# Altium project MM32F3277G9P.PrjPCB
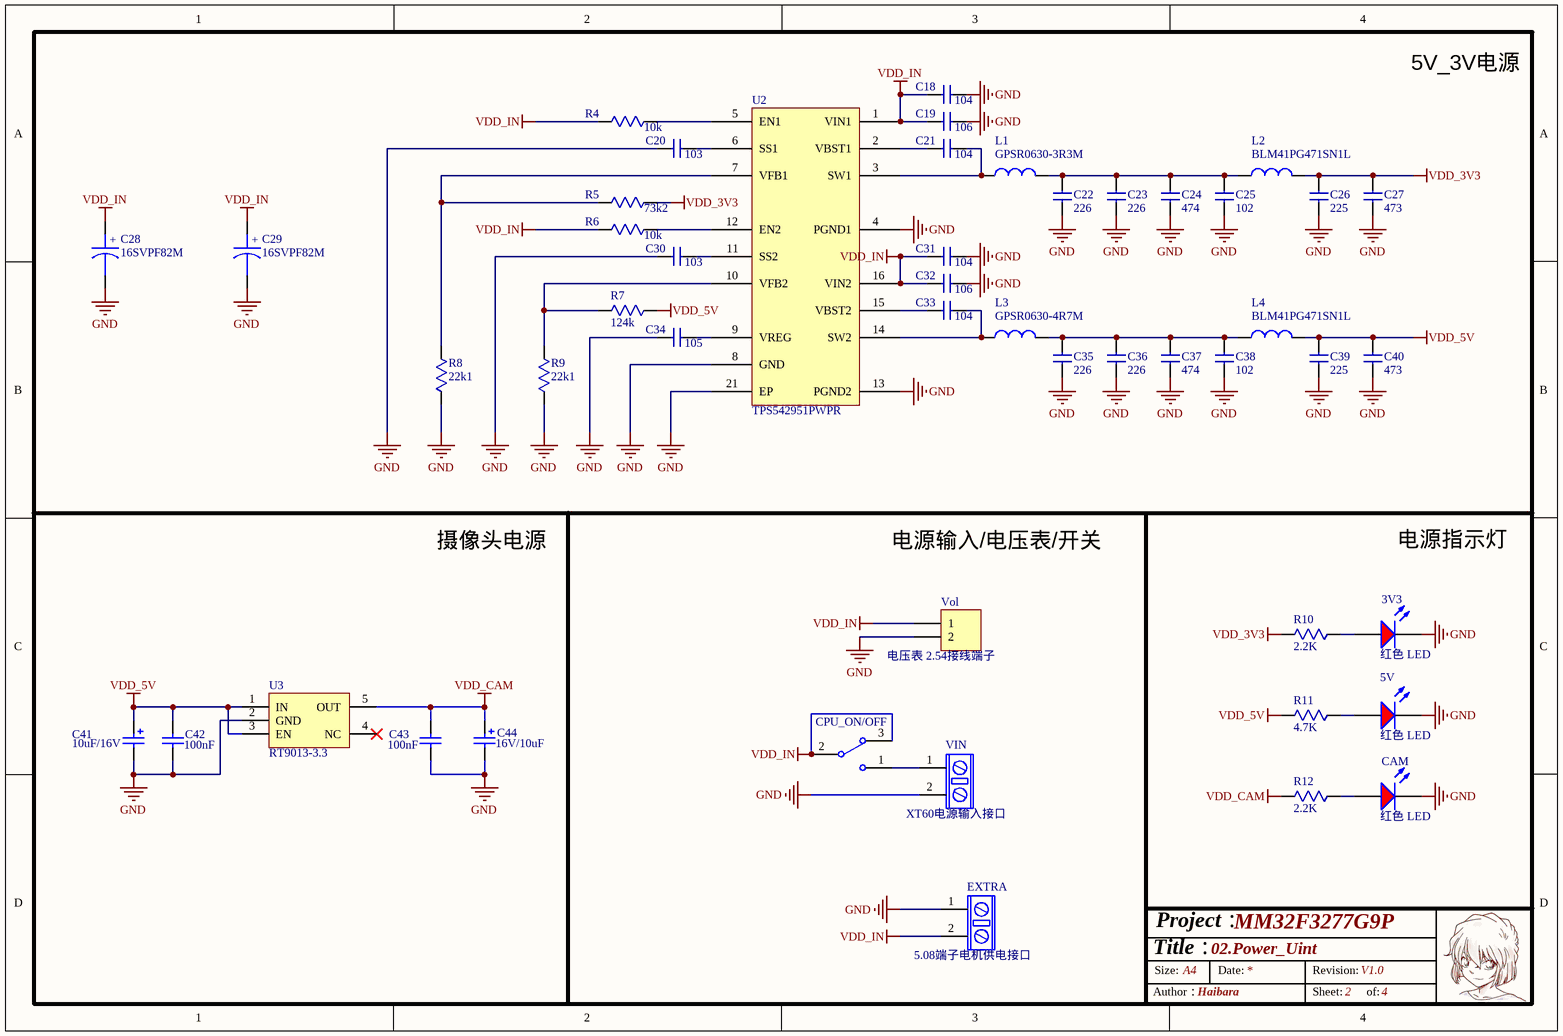
[diagram p0: 02.Power_Uint.SchDoc]
3 sheets, 90 parts. Net scope: global (net labels, ports and power ports of the same name join across sheets).
Board files: MM32F3277G9P V2.PcbDoc, MM32F3277G9P.PcbDoc
Sheets:
  02.Power_Uint.SchDoc
  03.Communicate.SchDoc
  04.Input_Output.SchDoc

## Sheet 02.Power_Uint.SchDoc: 02.Power_Uint
size A4; Organization: Altium Limited; Address1: L3, 12a Rodborough Rd; Address2: Frenchs Forest; Address3: NSW; Address4: Australia 2086; SheetNumber: 2; SheetTotal: 4

### Parts
3V3  红色 LED  [0603 LED R]
5V  红色 LED  [0603 LED R]
C18  104  [C0603]
C19  106  [C0805]
C20  103  [C0603]
C21  104  [C0805]
C22  226  [C0805]
C23  226  [C0805]
C24  474  [C0603]
C25  102  [C0603]
C26  225  [C0603]
C27  473  [C0603]
C28  16SVPF82M  [CAP 2.5*6.3*11.2]
C29  16SVPF82M  [CAP 2.5*6.3*11.2]
C30  103  [C0603]
C31  104  [C0603]
C32  106  [C0805]
C33  104  [C0805]
C34  105  [C0603]
C35  226  [C0805]
C36  226  [C0805]
C37  474  [C0603]
C38  102  [C0603]
C39  225  [C0603]
C40  473  [C0603]
C41  10UF  [C0805]  (value not drawn)
C42  100nF  [0603 电容 C3]
C43  100nF  [0603 电容 C3]
C44  value 16V/10uF  [C0805]  (hidden comment: 10UF)
CAM  红色 LED  [0603 LED R]
CPU_ON/OFF  SW-SPDT  [MTS-102S 两档纽子开关]  (value not drawn)
EXTRA  5.08端子电机供电接口  [5.08 螺钉式 2p]
L1  GPSR0630-3R3M  [L 0630]
L2  BLM41PG471SN1L  [R1206]
L3  GPSR0630-4R7M  [L 0630]
L4  BLM41PG471SN1L  [R1206]
R4  10k  [R0603]
R5  73k2  [R0603]
R6  10k  [R0603]
R7  124k  [R0603]
R8  22k1  [R0603]
R9  22k1  [R0603]
R10  2.2K  [R0603]
R11  4.7K  [R0603]
R12  2.2K  [R0603]
U2  TPS542951PWPR  [SSOP16_EP]
U3  RT9013-3.3  [SOT23-5N]
VIN  XT60电源输入接口  [XT60 母头 电源接口]
Vol  电压表 2.54接线端子  [XH2.54-LI-2P]

### Nets
GND: 3V3.2 5V.2 C18.2 C19.2 C20.1 C22.1 C23.1 C24.1 C25.1 C26.1 C27.1 C28.2 C29.2 C30.1 C31.2 C32.2 C34.1 C35.1 C36.1 C37.1 C38.1 C39.1 C40.1 C41.2 C42.1 C43.1 C44.2 CAM.2 EXTRA.1 R8.1 R9.1 U2.4(PGND1) U2.8(GND) U2.13(PGND2) U2.21(EP) U3.2(GND) VIN.2 Vol.2
VDD_3V3: C26.2 C27.2 L2.2 R5.1 R10.1
VDD_5V: C39.2 C40.2 C41.1 C42.2 L4.2 R7.1 R11.1 U3.1(IN) U3.3(EN)
VDD_CAM: C43.2 C44.1 R12.1 U3.5(OUT)
VDD_IN: C18.1 C19.1 C28.1 C29.1 C31.1 C32.1 CPU_ON/OFF.2 CPU_ON/OFF.3 EXTRA.2 R4.2 R6.2 U2.1(VIN1) U2.16(VIN2) Vol.1
Net3V3_1: 3V3.1 R10.2
Net5V_1: 5V.1 R11.2
NetC20_2: C20.2 U2.6(SS1)
NetC21_1: C21.1 U2.2(VBST1)
NetC21_2: C21.2 L1.1 U2.3(SW1)
NetC22_2: C22.2 C23.2 C24.2 C25.2 L1.2 L2.1
NetC30_2: C30.2 U2.11(SS2)
NetC33_1: C33.1 U2.15(VBST2)
NetC33_2: C33.2 L3.1 U2.14(SW2)
NetC34_2: C34.2 U2.9(VREG)
NetC35_2: C35.2 C36.2 C37.2 C38.2 L3.2 L4.1
NetCAM_1: CAM.1 R12.2
NetCPU_ON/OFF_1: CPU_ON/OFF.1 VIN.1
NetR4_1: R4.1 U2.5(EN1)
NetR5_2: R5.2 R8.2 U2.7(VFB1)
NetR6_1: R6.1 U2.12(EN2)
NetR7_2: R7.2 R9.2 U2.10(VFB2)

Not connected (* = marked no-connect by the designer): U3 4(NC)*

### Notes on the sheet
- Labels drawn without touching a wire or pin: 5V_3V电源, 摄像头电源, 电源指示灯, 电源输入/电压表/开关
- Title：
- Size:
- Project：
- A4
- Date:
- MM32F3277G9P
- Revision:
- V1.0
- Author：
- Haibara
- Sheet:
- of:
- (in symbol CAP POL) +
- (in symbol Cap Pol2) 16V

### Library data of the parts
3V3 5V CAM = 红灯: 发光二极管; ComponentLink1Description: 供应商链接; ComponentLink1URL: http://www.szlcsc.com/product/details_2668.html; Package: 0805; Supplier: LC; SuppliersPartNumber: C2295
C18-C27 C30-C40 = 电容
C28 C29 = CAP POL: Capacitor
C41 C44 = Cap Pol2: Polarized Capacitor (Axial); Published: 8-Jun-2000; LatestRevisionDate: 17-Jul-2002; LatestRevisionNote: Re-released for DXP Platform.; PackageReference: POLAR0.8; Publisher: Altium Limited; PackageDescription: Polarized Capacitor; 2 Leads
C42 C43 = Cap: Capacitor; Published: 8-Jun-2000; LatestRevisionDate: 17-Jul-2002; LatestRevisionNote: Re-released for DXP Platform.; PackageReference: RAD-0.3; Publisher: Altium Limited; PackageDescription: Radial Cap, Thru-Hole; 2 Leads; 0.3 in Pin Spacing
CPU_ON/OFF = SW-SPDT: SPDT Subminiature Toggle Switch, Right Angle Mounting, Vertical Actuation; Published: 24-Mar-1999; LatestRevisionDate: 17-Dec-2003; LatestRevisionNote: Schematic revised, PCB Footprint replaced.; DatasheetVersion: 05-Dec-2000; PackageReference: TL36WW15050; Publisher: Altium Limited; PackageDescription: Switch; 4 Leads; ComponentLink1Description: Manufacturer Link; ComponentLink1URL: http://www.apem.com
EXTRA VIN = 电机供电接口
L1 L3 = 电感
L2 L4 = 磁珠: BLM18PG471SN1D
R4-R12 = 电阻
U3 = RT9013-3.3: 3.3V电源芯片
Vol = Header 2: Header, 2-Pin; LatestRevisionDate: 17-Jul-2002; LatestRevisionNote: Re-released for DXP Platform.; Publisher: Altium Limited

## Sheet 03.Communicate.SchDoc: 03.Communicate
size A4; Organization: Altium Limited; Address1: L3, 12a Rodborough Rd; Address2: Frenchs Forest; Address3: NSW; Address4: Australia 2086; SheetNumber: 3; SheetTotal: 4
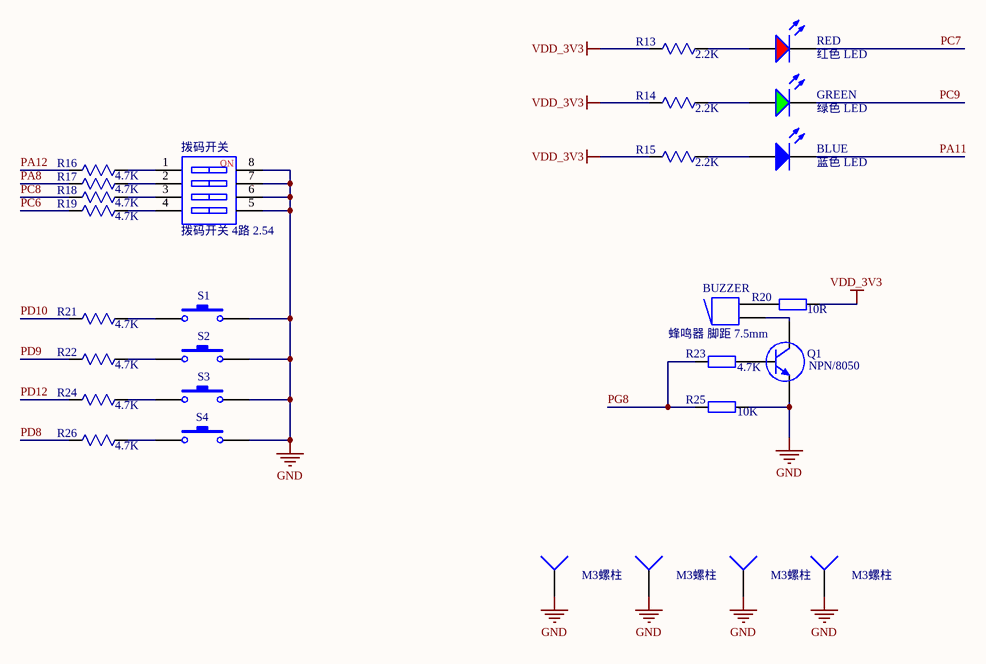
[diagram p1: 03.Communicate.SchDoc]

### Parts
BLUE  蓝色 LED  [0603 LED B]
BUZZER  蜂鸣器 脚距 7.5mm  [蜂鸣器5.5mm脚距]
GREEN  绿色 LED  [0603 LED G]
J1  M3螺柱  [MTGP720H320V6P - duplicate]
J2  M3螺柱  [MTGP720H320V6P - duplicate]
J3  M3螺柱  [MTGP720H320V6P - duplicate]
J4  M3螺柱  [MTGP720H320V6P - duplicate]
Q1  NPN/8050  [SOT232-3 三极管]
R13  2.2K  [R0603]
R14  2.2K  [R0603]
R15  2.2K  [R0603]
R16  4.7K  [R0603]
R17  4.7K  [R0603]
R18  4.7K  [R0603]
R19  4.7K  [R0603]
R20  value 10R  [0603 电阻 R3]  (hidden comment: 4.7K)
R21  4.7K  [R0603]
R22  4.7K  [R0603]
R23  4.7K  [0603 电阻 R3]
R24  4.7K  [R0603]
R25  value 10K  [0603 电阻 R3]  (hidden comment: 4.7K)
R26  4.7K  [R0603]
RED  红色 LED  [0603 LED R]
S1  SW-PB  [TSW SMD-3*6*2.5]  (value not drawn)
S2  SW-PB  [TSW SMD-3*6*2.5]  (value not drawn)
S3  SW-PB  [TSW SMD-3*6*2.5]  (value not drawn)
S4  SW-PB  [TSW SMD-3*6*2.5]  (value not drawn)
拨码开关  拨码开关 4路 2.54  [CSW DIP-2P_G]

### Nets
GND: J1.1 J2.1 J3.1 J4.1 Q1.2(E) R25.2 S1.2 S2.2 S3.2 S4.2 拨码开关.5 拨码开关.6 拨码开关.7 拨码开关.8
VDD_3V3: R13.1 R14.1 R15.1 R20.2
PA8: R17.1
PA11: BLUE.2
PA12: R16.1
PC6: R19.1
PC7: RED.2
PC8: R18.1
PC9: GREEN.2
PD8: R26.1
PD9: R22.1
PD10: R21.1
PD12: R24.1
PG8: R23.1 R25.1
NetBLUE_1: BLUE.1 R15.2
NetBUZZER_1: BUZZER.1 R20.1
NetBUZZER_2: BUZZER.2 Q1.3(C)
NetGREEN_1: GREEN.1 R14.2
NetQ1_1: Q1.1(B) R23.2
NetR13_2: R13.2 RED.1
NetR16_2: R16.2 拨码开关.1
NetR17_2: R17.2 拨码开关.2
NetR18_2: R18.2 拨码开关.3
NetR19_2: R19.2 拨码开关.4
NetR21_2: R21.2 S1.1
NetR22_2: R22.2 S2.1
NetR24_2: R24.2 S3.1
NetR26_2: R26.2 S4.1

### Notes on the sheet
- Title：
- Size:
- Project：
- A4
- Date:
- MM32F3277G9P
- Revision:
- V1.0
- Author：
- Haibara
- Sheet:
- of:
- (in symbol CSW-4P) NO

### Library data of the parts
BLUE = 蓝灯: 发光二极管; ComponentLink1Description: 供应商链接; ComponentLink1URL: http://www.szlcsc.com/product/details_2666.html; Package: 0805; Supplier: LC; SuppliersPartNumber: C2293
BUZZER = Buzzer: Magnetic Transducer Buzzer; Published: 24-Mar-1999; LatestRevisionDate: 17-Dec-2003; LatestRevisionNote: Schematic revised, PCB Footprint replaced.; DatasheetVersion: 17-Dec-2003; PackageReference: ABSM-1574; Publisher: Altium Limited; PackageDescription: Magnetic Transducer Buzzer; ComponentLink1Description: Manufacturer Link; ComponentLink1URL: http://www.megastar.com/linecard/buzzmode/index.php
GREEN = 绿灯: 发光二极管; ComponentLink1Description: 供应商链接; ComponentLink1URL: http://www.szlcsc.com/product/details_2670.html; Package: 0805; Supplier: LC; SuppliersPartNumber: C2297
J1-J4 = Socket: LatestRevisionDate: 17-Jul-2002; LatestRevisionNote: Re-released for DXP Platform.; Publisher: Altium Limited
R13-R19 R21 R22 R24 R26 = 电阻
R20 R25 = Res2: Resistor; Published: 8-Jun-2000; LatestRevisionDate: 17-Jul-2002; LatestRevisionNote: Re-released for DXP Platform.; PackageReference: AXIAL-0.4; Publisher: Altium Limited; PackageDescription: Axial Device, Thru-Hole; 2 Leads; 0.4 in Pin Spacing
R23 = Res2: Resistor; Value: 4.7R; Published: 8-Jun-2000; LatestRevisionDate: 17-Jul-2002; LatestRevisionNote: Re-released for DXP Platform.; PackageReference: AXIAL-0.4; Publisher: Altium Limited; PackageDescription: Axial Device, Thru-Hole; 2 Leads; 0.4 in Pin Spacing
RED = 红灯: 发光二极管; ComponentLink1Description: 供应商链接; ComponentLink1URL: http://www.szlcsc.com/product/details_2668.html; Package: 0805; Supplier: LC; SuppliersPartNumber: C2295
S1-S4 = SW-PB: Switch; Published: 24-Mar-1999; LatestRevisionDate: 17-Jul-2002; LatestRevisionNote: Re-released for DXP Platform.; PackageReference: SPST-2; Publisher: Altium Limited; PackageDescription: Switch; 2 Leads
拨码开关 = CSW-4P: 4路编码开关; 版权归属: 源创客; BOM名称: 4路编码开关; 学习资源: www.ooocke.com

## Sheet 04.Input_Output.SchDoc: 04.Input_Output
size A4; Organization: Altium Limited; Address1: L3, 12a Rodborough Rd; Address2: Frenchs Forest; Address3: NSW; Address4: Australia 2086; SheetNumber: 4; SheetTotal: 4
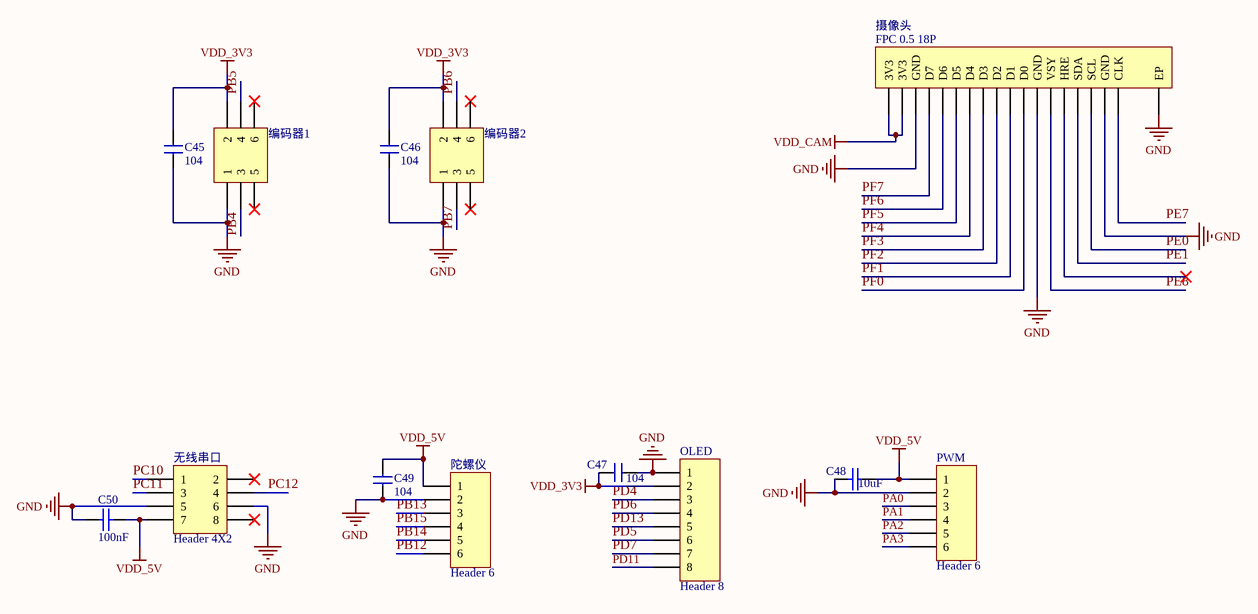
[diagram p2: 04.Input_Output.SchDoc]

### Parts
C45  104  [C0603]
C46  104  [C0603]
C47  104  [C0603]
C48  10UF  [0603 电容 C3]
C49  104  [C0603]
C50  100nF  [0603 电容 C3]
OLED  Header 8  [HDR2.54-LI-8P]
PWM  Header 6  [MX 1.25-WS-6P]
摄像头  FPC 0.5 18P  [FPC0.5 2H-WS-18P]
无线串口  Header 4X2  [HDR2.54-LI-2x4P]
编码器1  Header 3X2  [DC-2.54-L-Z-6P]  (value not drawn)
编码器2  Header 3X2  [DC-2.54-L-Z-6P]  (value not drawn)
陀螺仪  Header 6  [MX 1.25-WS-6P]

### Nets
GND: C45.1 C46.1 C47.2 C48.1 C49.1 C50.2 OLED.1 PWM.2 摄像头.0(EP) 摄像头.3(GND) 摄像头.12(GND) 摄像头.17(GND) 无线串口.5 无线串口.6 编码器1.1 编码器2.1 陀螺仪.2
VDD_3V3: C45.2 C46.2 C47.1 OLED.2 编码器1.2 编码器2.2
VDD_5V: C48.2 C49.2 C50.1 PWM.1 无线串口.7 陀螺仪.1
VDD_CAM: 摄像头.1(3V3) 摄像头.2(3V3)
PA0: PWM.3
PA1: PWM.4
PA2: PWM.5
PA3: PWM.6
PB4: 编码器1.3
PB5: 编码器1.4
PB6: 编码器2.4
PB7: 编码器2.3
PB12: 陀螺仪.6
PB13: 陀螺仪.3
PB14: 陀螺仪.5
PB15: 陀螺仪.4
PC10: 无线串口.1
PC11: 无线串口.3
PC12: 无线串口.4
PD4: OLED.3
PD5: OLED.6
PD6: OLED.4
PD7: OLED.7
PD11: OLED.8
PD13: OLED.5
PE0: 摄像头.16(SCL)
PE1: 摄像头.15(SDA)
PE7: 摄像头.18(CLK)
PE8: 摄像头.13(VSY)
PF0: 摄像头.11(D0)
PF1: 摄像头.10(D1)
PF2: 摄像头.9(D2)
PF3: 摄像头.8(D3)
PF4: 摄像头.7(D4)
PF5: 摄像头.6(D5)
PF6: 摄像头.5(D6)
PF7: 摄像头.4(D7)

Not connected (* = marked no-connect by the designer): 摄像头 14(HRE)*; 无线串口 2* 8*; 编码器1 5* 6*; 编码器2 5* 6*

### Notes on the sheet
- Title：
- Size:
- Project：
- A4
- Date:
- MM32F3277G9P
- Revision:
- V1.0
- Author：
- Haibara
- Sheet:
- of:

### Library data of the parts
C45-C47 C49 = 电容
C48 C50 = Cap: Capacitor; Published: 8-Jun-2000; LatestRevisionDate: 17-Jul-2002; LatestRevisionNote: Re-released for DXP Platform.; PackageReference: RAD-0.3; Publisher: Altium Limited; PackageDescription: Radial Cap, Thru-Hole; 2 Leads; 0.3 in Pin Spacing
  C48: Value: 10uF
OLED = Header 8: Header, 8-Pin; LatestRevisionDate: 17-Jul-2002; LatestRevisionNote: Re-released for DXP Platform.; Publisher: Altium Limited
PWM 陀螺仪 = Header 6: Header, 6-Pin; LatestRevisionDate: 17-Jul-2002; LatestRevisionNote: Re-released for DXP Platform.; Publisher: Altium Limited
摄像头 = 18P Cam: Header, 25-Pin; LatestRevisionDate: 17-Jul-2002; LatestRevisionNote: Re-released for DXP Platform.; Publisher: Altium Limited
无线串口 = Header 4X2: Header, 4-Pin, Dual row; LatestRevisionDate: 17-Jul-2002; LatestRevisionNote: Re-released for DXP Platform.; Publisher: Altium Limited
编码器1 编码器2 = Header 3X2: Header, 3-Pin, Dual row; LatestRevisionDate: 17-Jul-2002; LatestRevisionNote: Re-released for DXP Platform.; Publisher: Altium Limited

## Nets that join several sheets
GND: 02.Power_Uint (38 pins), 03.Communicate (14 pins), 04.Input_Output (17 pins)
VDD_3V3: 02.Power_Uint (5 pins), 03.Communicate (R13.1 R14.1 R15.1 R20.2), 04.Input_Output (6 pins)
VDD_5V: 02.Power_Uint (9 pins), 04.Input_Output (6 pins)
VDD_CAM: 02.Power_Uint (C43.2 C44.1 R12.1 U3.5), 04.Input_Output (摄像头.1 摄像头.2)